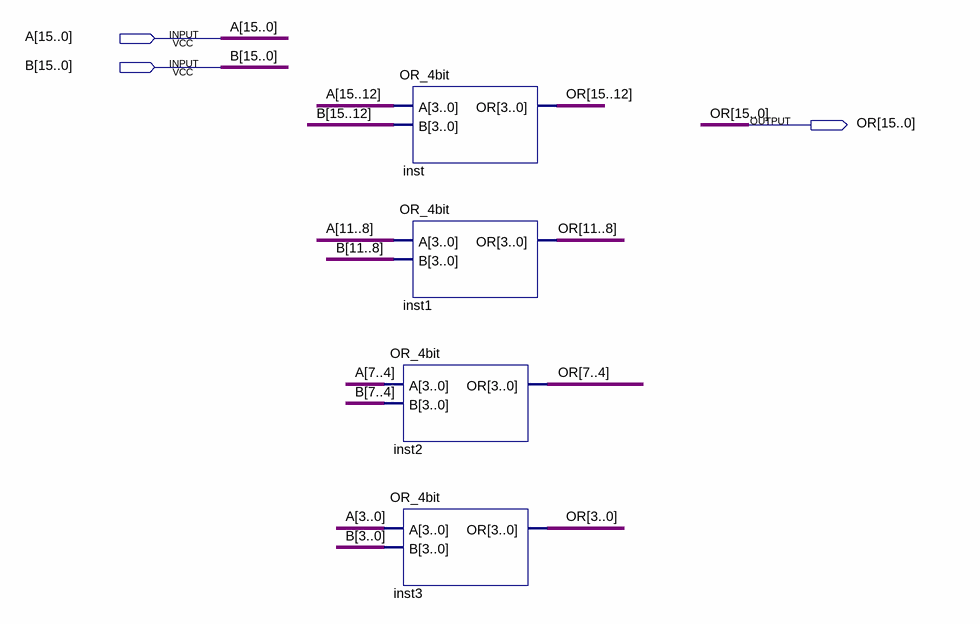
[diagram p0: schematic sheet]
// Quartus schematic OR_16bit.bdf as structural Verilog: 4 symbols, 3 pins
module OR_16bit (
  input  [15:0] A,
  input  [15:0] B,
  output [15:0] OR
);

  OR_4bit inst (.A(A[15:12]), .B(B[15:12]), .OR(OR[15:12]));
  OR_4bit inst1 (.A(A[11:8]), .B(B[11:8]), .OR(OR[11:8]));
  OR_4bit inst2 (.A(A[7:4]), .B(B[7:4]), .OR(OR[7:4]));
  OR_4bit inst3 (.A(A[3:0]), .B(B[3:0]), .OR(OR[3:0]));
endmodule
